# Altium schematic sheet ffultra_power.SchDoc
size A4; SheetNumber: 8; SheetTotal: 13
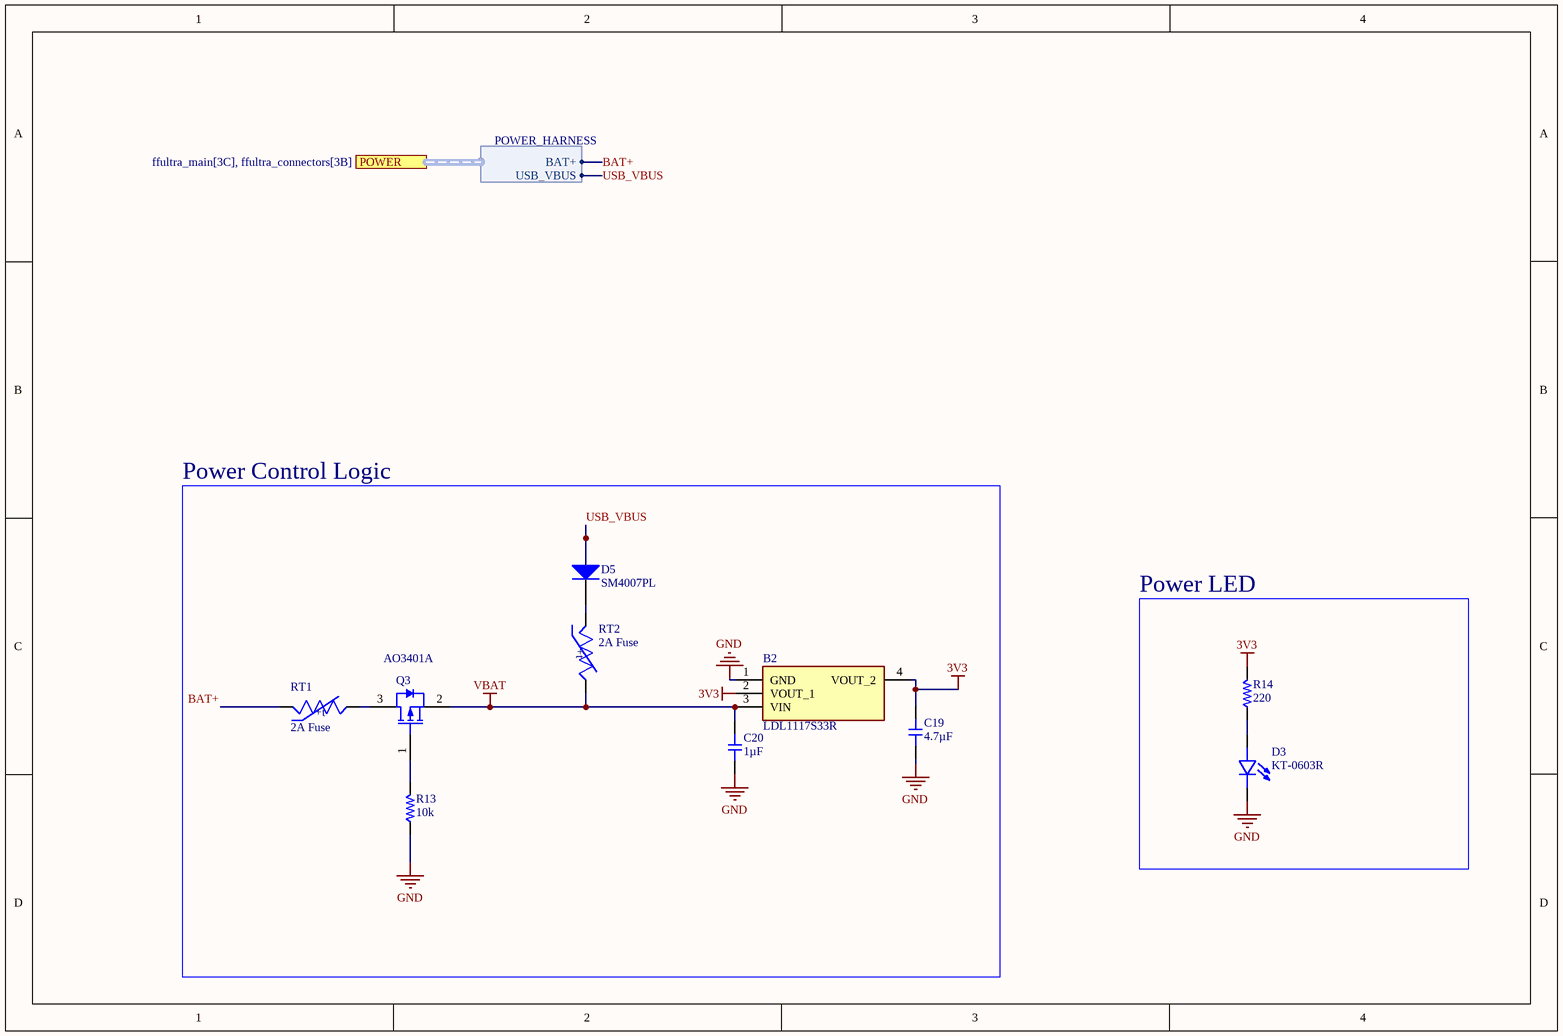
[diagram p0: ffultra_power.SchDoc]

## Parts
B2  LDL1117S33R  [SOT230P700X180-4N]
C19  value 4.7µF  [CAP-0402]  (hidden comment: CL05A475MP5NRNC)
C20  value 1µF  [CAP-0402]  (hidden comment: CL05A105KA5NQNC)
D3  KT-0603R  [LED_KT-0603R]
D5  SM4007PL  [MCC-SOD-123FL_V]
Q3  AO3401A  [AO-SOT-23-3L_V]
R13  value 10k  [RES-0402]  (hidden comment: 0402WGF1002TCE)
R14  value 220  [RES-0402]  (hidden comment: 0402WGF2200TCE)
RT1  2A Fuse  [THRMC1608X95N]
RT2  2A Fuse  [THRMC1608X95N]

## Blocks framed on the sheet
Power Control Logic: B2 C19 C20 D5 Q3 R13 RT1 RT2
Power LED: D3 R14

## Ports
POWER (harness POWER_HARNESS, see ffultra_main[3C], ffultra_connectors[3B])

## Harnesses
POWER_HARNESS: BAT+, USB_VBUS

## Nets
3V3: B2.2(VOUT_1) B2.4(VOUT_2) C19.2 R14.2
GND: B2.1(GND) C19.1 C20.1 D3.C R13.1
VBAT: B2.3(VIN) C20.2 Q3.2(SOURCE) RT2.2
BAT+: RT1.1 ; port POWER.BAT+
USB_VBUS: D5.1(A) ; port POWER.USB_VBUS
NetD3_A: D3.A R14.1
NetD5_2: D5.2(K) RT2.1
NetQ3_1: Q3.1(GATE) R13.2
NetQ3_3: Q3.3(DRAIN) RT1.2

## Notes on the sheet
- (in symbol CMP-038-000000-2) +t

## Library data of the parts
B2 = CMP-172-000000-3: STMICROELECTRONICS - LDL1117S33R - LDO, FIXED, 3.3V, 1.2A, SOT-223-3; Geometry.Height: 1.8mm; Manufacturer_Name: STMicroelectronics; Design Item ID: LDL1117S33R; Datasheet Link: https://componentsearchengine.com/Datasheets/2/LDL1117S33R.pdf; Source: LDL1117S33R.SchLib; Mouser Price/Stock: https://www.mouser.co.uk/ProductDetail/STMicroelectronics/LDL1117S33R?qs=AQlKX63v8Rt9Bf6AWSrbFg%3D%3D; Manufacturer_Part_Number: LDL1117S33R; Mouser Part Number: 511-LDL1117S33R; JLCPCB Part Number: C435835
C19 = CMP-001-00139-1: Capacitor, Ceramic (MLCC), 4.7uF, ±20%, 10V, X5R, ±20%, SMD 0402; Manufacturer: Samsung Electro-Mechanics; RoHS: Yes; Tolerance: 20%; Manufacturer Part Number: CL05A475MP5NRNC; ComponentLink3Description: LCSC Part URL; Source: jlcpcb_capacitors_basic.schlib; JLCPCB Part Number: C23733; ComponentLink2Description: JLCPCB Part URL; Temperature Coefficient: X5R; Voltage Rating: 10V; JLCPCB Basic Part: Yes; Case/Package: 0402; Category: Capacitors - MLCC; ComponentLink1URL: https://datasheet.lcsc.com/lcsc/1810191211_Samsung-Electro-Mechanics-CL05A475MP5NRNC_C23733.pdf; ComponentLink2URL: https://jlcpcb.com/partdetail/C23733; ComponentLink1Description: Datasheet; ComponentLink3URL: https://lcsc.com/product-detail/Multilayer-Ceramic-Capacitors-MLCC---SMD-SMT_Samsung-Electro-Mechanics-Samsung-Electro-Mechanics-CL05A475MP5NRNC_C23733.html; Design Item ID: CL05A475MP5NRNC
C20 = CMP-001-00135-1: Capacitor, Ceramic (MLCC), 1uF, ±10%, 25V, X5R, ±10%, SMD 0402; Manufacturer: Samsung Electro-Mechanics; Voltage Rating: 25V; RoHS: Yes; Temperature Coefficient: X5R; Tolerance: 10%; Source: jlcpcb_capacitors_basic.schlib; ComponentLink1URL: https://datasheet.lcsc.com/lcsc/1811091611_Samsung-Electro-Mechanics-CL05A105KA5NQNC_C52923.pdf; JLCPCB Basic Part: Yes; ComponentLink1Description: Datasheet; ComponentLink2URL: https://jlcpcb.com/partdetail/C52923; Case/Package: 0402; ComponentLink3Description: LCSC Part URL; Manufacturer Part Number: CL05A105KA5NQNC; ComponentLink3URL: https://lcsc.com/product-detail/Multilayer-Ceramic-Capacitors-MLCC---SMD-SMT_Samsung-Electro-Mechanics-Samsung-Electro-Mechanics-CL05A105KA5NQNC_C52923.html; Design Item ID: CL05A105KA5NQNC; JLCPCB Part Number: C52923; ComponentLink2Description: JLCPCB Part URL; Category: Capacitors - MLCC
D3 = CMP-004-00035-2: Red 0603 Light Emitting Diodes; MF: Hubei KENTO Elec; Value: *; Pins: 2; Design Item ID: KT-0603R; MP: KT-0603R; Case/Package: Package; Component Type: Standard; Check_prices: https://www.snapeda.com/parts/KT-0603R/Hubei+KENTO+Elec/view-part/?ref=eda; SnapEDA_Link: https://www.snapeda.com/parts/KT-0603R/Hubei+KENTO+Elec/view-part/?ref=snap; JLCPCB Part Number: C2286; Source: KT-0603R.SchLib
D5 = CMP-004-00034-1: DIODE GEN PURP 1KV 1A SOD123FL; LCSC Part #: C64898; JLCPCB Part Number: C64898
Q3 = CMP-013-00037-1: P沟道 VDS=-30V VGS=±12V ID=-4A P=1.4W; JLCPCB Part Number: C15127
R13 = CMP-009-00191-1: Resistor, 10kΩ, ±1%, 62.5mW, 50V, ±100ppm/℃, -55℃~+155℃, SMD 0402; Manufacturer: Uniroyal; Temperature Rating: -55℃~+155℃; ComponentLink1URL: https://datasheet.lcsc.com/lcsc/2206010100_UNI-ROYAL-Uniroyal-Elec-0402WGF1002TCE_C25744.pdf; Source: jlcpcb_resistors_basic.schlib; Tolerance: 1%; Design Item ID: 0402WGF1002TCE; ComponentLink1Description: Datasheet; ComponentLink2URL: https://jlcpcb.com/partdetail/C25744; Category: Resistors; JLCPCB Part Number: C25744; ComponentLink2Description: JLCPCB Part URL; Temperature Coefficient: ±100ppm/℃; JLCPCB Basic Part: Yes; Power Rating: 62.5mW; Case/Package: 0402; Voltage Rating: 50V; Manufacturer Part Number: 0402WGF1002TCE
R14 = CMP-009-00210-1: Resistor, 220Ω, ±1%, 62.5mW, 50V, ±100ppm/℃, -55℃~+155℃, SMD 0402; Manufacturer: Uniroyal; Category: Resistors; Case/Package: 0402; Temperature Rating: -55℃~+155℃; Temperature Coefficient: ±100ppm/℃; ComponentLink2URL: https://jlcpcb.com/partdetail/C25091; Tolerance: 1%; JLCPCB Part Number: C25091; Source: jlcpcb_resistors_basic.schlib; Power Rating: 62.5mW; Design Item ID: 0402WGF2200TCE; ComponentLink1URL: https://datasheet.lcsc.com/lcsc/2205311900_UNI-ROYAL-Uniroyal-Elec-0402WGF2200TCE_C25091.pdf; JLCPCB Basic Part: Yes; Manufacturer Part Number: 0402WGF2200TCE; Voltage Rating: 50V; ComponentLink2Description: JLCPCB Part URL; ComponentLink1Description: Datasheet
RT1 RT2 = CMP-038-000000-2: PTC Resettable Fuse: 2A Hold, 4A Trip, 0603; Hold Current: 2A; Pin Count: 2; Component Type: Standard; Availability: Unavailable; MP: BSMD0603L-200; Package: 0603; Design Item ID: BSMD0603L-200; Trip Current: 4A; JLCPCB Part Number: C2757930